# Altium schematic sheet Terminal-Sheet.SchDoc
size 420 x 297 mm; SheetNumber: 5; SheetTotal: 9
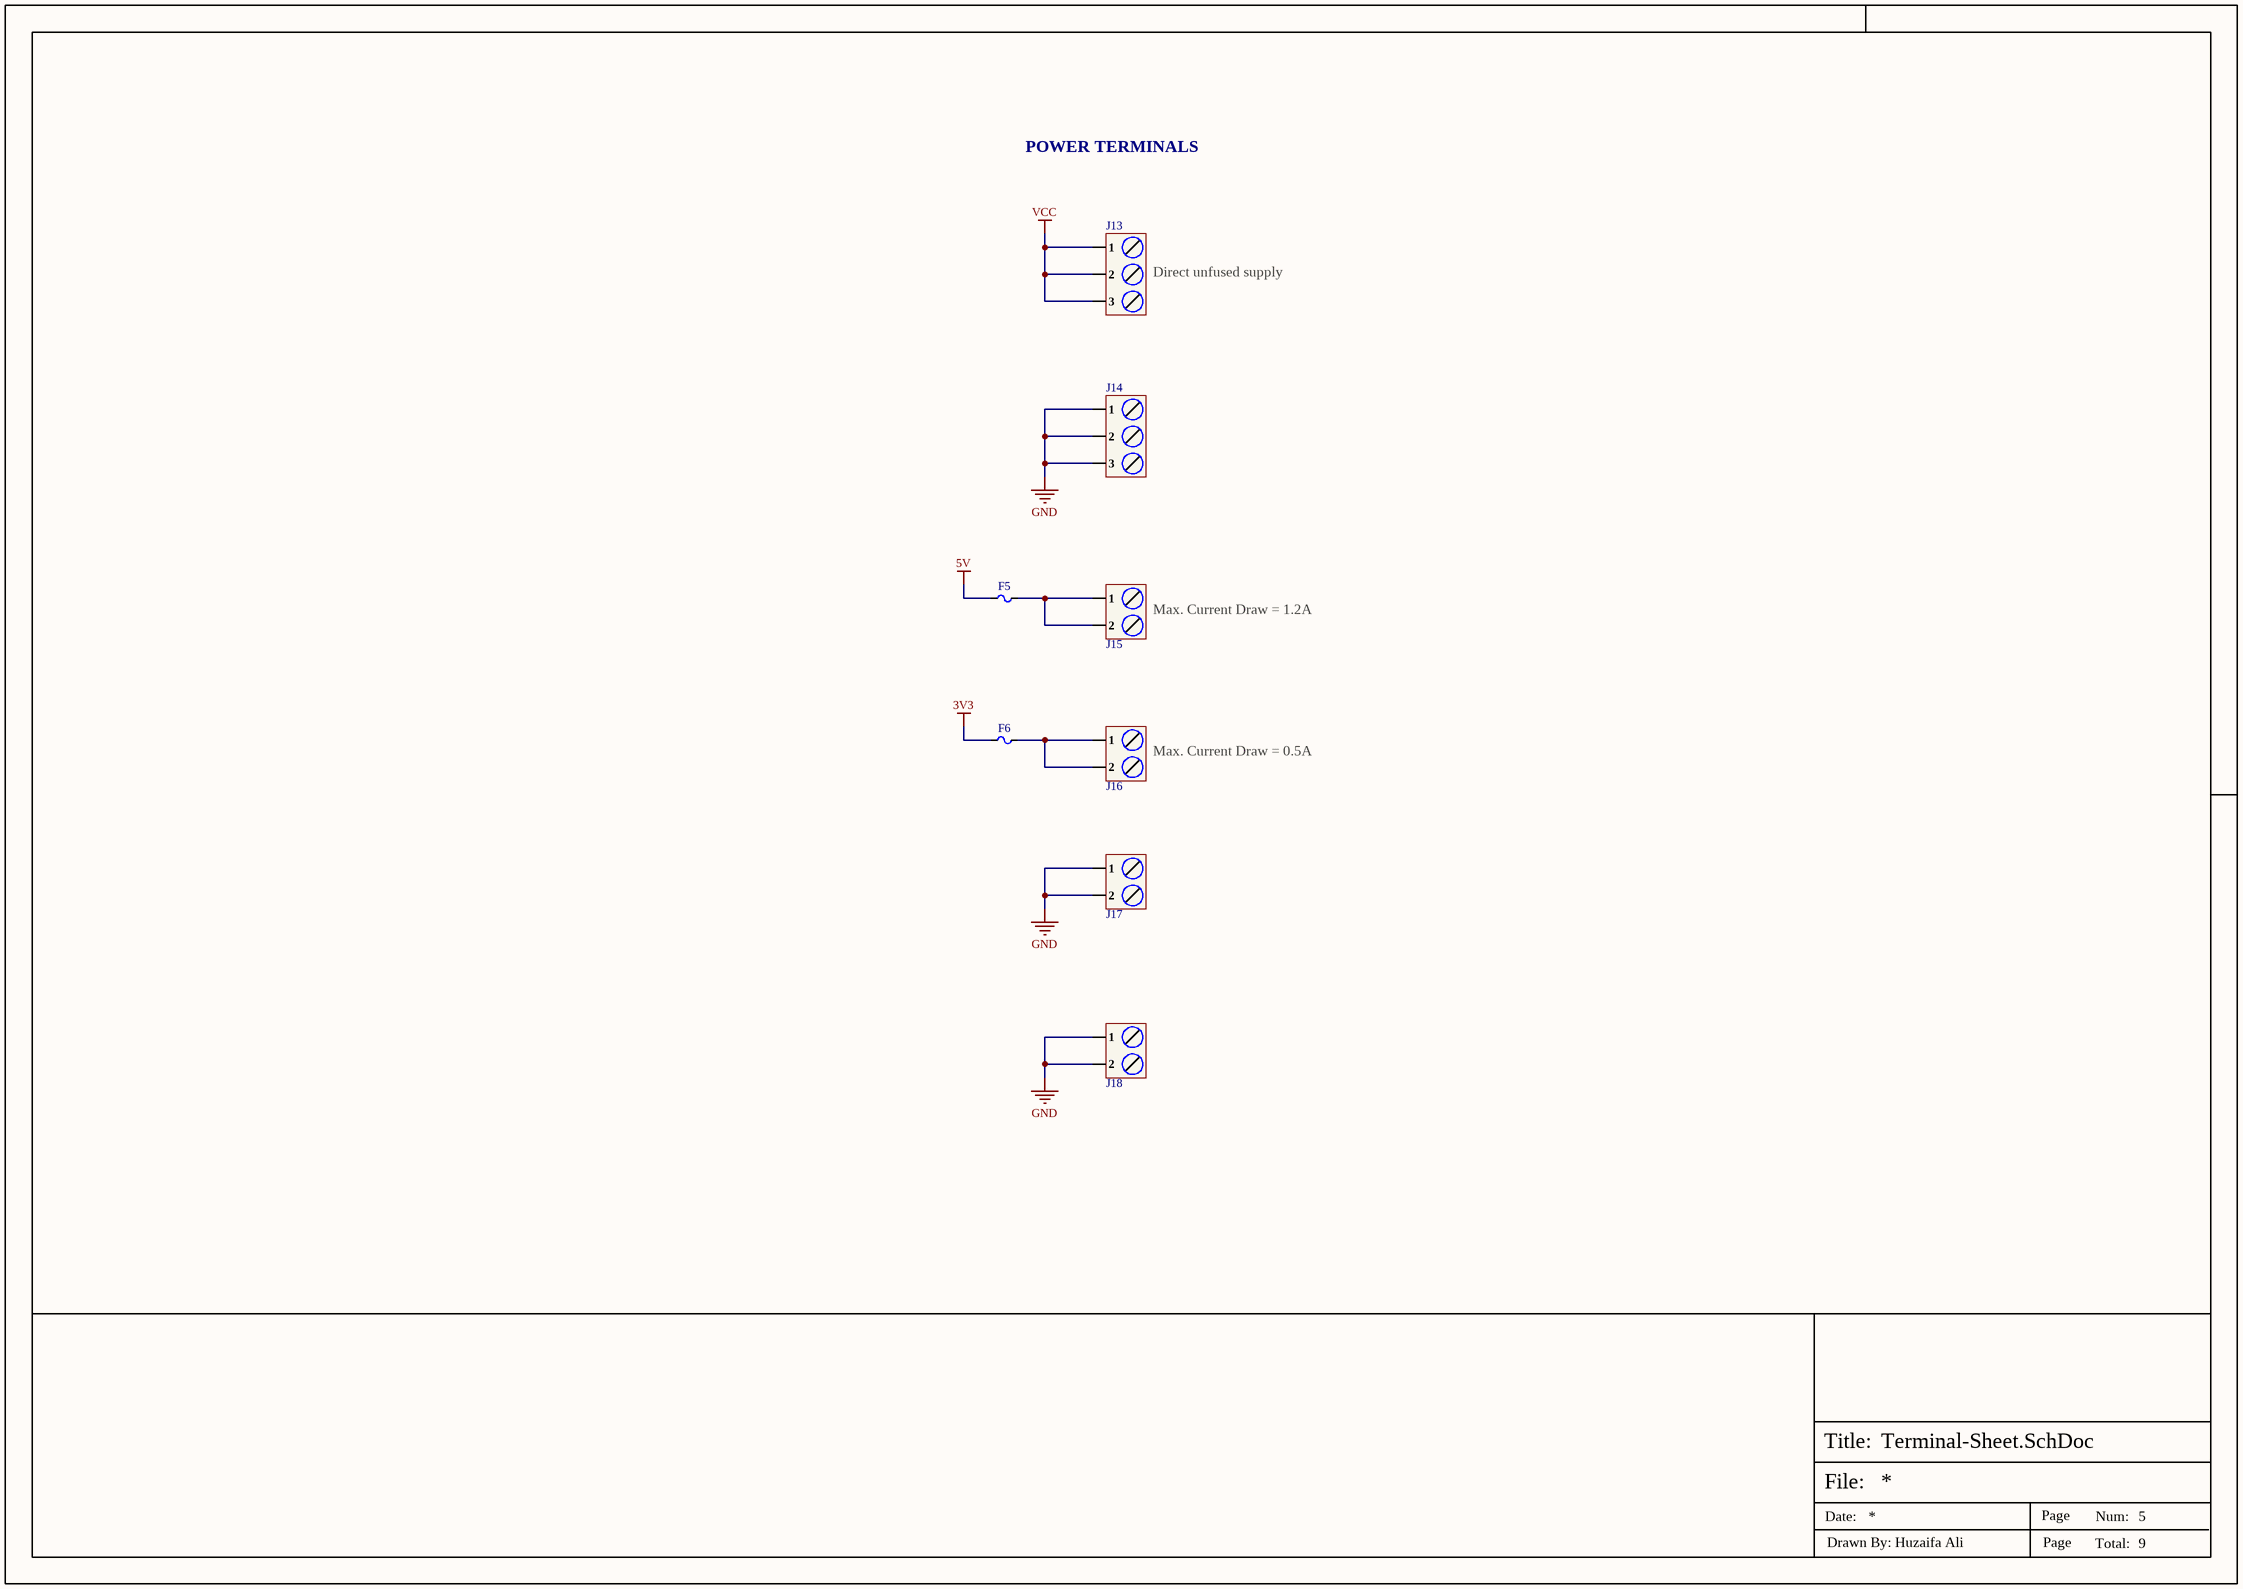
[diagram p0: Terminal-Sheet.SchDoc]

## Parts
F5  SMD0805B110TF  [Fuse-0805]  (value not drawn)
F6  0805L050WR  [Fuse-0805]  (value not drawn)
J13  DB128L-5.08-3P-GN-S  [DB128L-5.08-3P-GN-S]  (value not drawn)
J14  DB128L-5.08-3P-GN-S  [DB128L-5.08-3P-GN-S]  (value not drawn)
J15  DB128L-5.08-2P-GN-S  [DB128L-5.08-2P-GN-S]  (value not drawn)
J16  DB128L-5.08-2P-GN-S  [DB128L-5.08-2P-GN-S]  (value not drawn)
J17  DB128L-5.08-2P-GN-S  [DB128L-5.08-2P-GN-S]  (value not drawn)
J18  DB128L-5.08-2P-GN-S  [DB128L-5.08-2P-GN-S]  (value not drawn)

## Nets
3V3: F6.1
5V: F5.1
GND: J14.1 J14.2 J14.3 J17.1 J17.2 J18.1 J18.2
VCC: J13.1 J13.2 J13.3
NetF5_2: F5.2 J15.1 J15.2
NetF6_2: F6.2 J16.1 J16.2

## Notes on the sheet
- POWER TERMINALS
- (near J13) Direct unfused supply
- (near J15) Max. Current Draw = 1.2A
- (near J16) Max. Current Draw = 0.5A
- File:
- Title:
- Date:
- Page
- Num:
- Total:
- Drawn By: Huzaifa Ali

## Library data of the parts
F5 = SMD0805B110TF: PTC Resettable Fuse 6V 100A 2-Pin 0805 T/R; Manufacturer: Yageo; Item Type: PTC Resettable Fuses; Supplier: Digikey; LCSC Part Number: C269107; Manufacturer Part Number: SMD0805B110TF; RoHS: Yes; Stock: 3000; Pricing: 1=0.15, 5=0.126, 10=0.116, 50=0.0962, 100=0.0887, 250=0.07976, 500=0.07358, 1000=0.06788 (USD)
F6 = 0805L050WR: 6V 500mA 100A 1A 0805 Resettable Fuses ROHS; Manufacturer: Littelfuse; Item Type: Fuse; Supplier: DigiKey; Supplier Part Number: F2772CT-ND; Manufacturer Part Number: 0805L050WR; RoHS: Yes; Category: PTC Resettable Fuses; Stock: 52328; Pricing: 1=0.5, 5=0.41, 10=0.378, 50=0.314, 100=0.2897, 250=0.2604, 500=0.2402, 1000=0.2215 (USD); Voltage Rating: 6V; Width: 1.2mm; Height: 1.25mm; Lead Free: 5697LeadFree; ComponentLink1URL: https://datasheet.ciiva.com/326/littelfuse-ptc-0805l-326196.pdf?src-supplier=Digikey; ComponentLink1Description: https://datasheet.ciiva.com/326/littelfuse-ptc-0805l-326196.pdf?src-supplier=Digikey; ComponentLink2URL: https://datasheet.ciiva.com/4501/littelfuse-0805l-32472-4501285.pdf?src-supplier=Mouser; ComponentLink2Description: https://datasheet.ciiva.com/4501/littelfuse-0805l-32472-4501285.pdf?src-supplier=Mouser; ComponentLink3URL: https://datasheet.ciiva.com/28410/147852-28410764.pdf?src-supplier=Element14; ComponentLink3Description: https://datasheet.ciiva.com/28410/147852-28410764.pdf?src-supplier=Element14; ComponentLink4URL: https://datasheet.ciiva.com/8005/littelfuse-0805-8005343.pdf?src-supplier=Element14; ComponentLink4Description: https://datasheet.ciiva.com/8005/littelfuse-0805-8005343.pdf?src-supplier=Element14; ComponentLink5URL: https://datasheet.ciiva.com/1273/611626-1273580.pdf?src-supplier=Element14; ComponentLink5Description: https://datasheet.ciiva.com/1273/611626-1273580.pdf?src-supplier=Element14; ComponentLink6URL: https://datasheet.ciiva.com/15186/getdatasheetpartid-27833-15186860.pdf?src-supplier=Verical; ComponentLink6Description: https://datasheet.ciiva.com/15186/getdatasheetpartid-27833-15186860.pdf?src-supplier=Verical; ComponentLink7URL: https://datasheet.ciiva.com/16389/littelfuse-0805-16389019.pdf?src-supplier=Future+Electronics; ComponentLink7Description: https://datasheet.ciiva.com/16389/littelfuse-0805-16389019.pdf?src-supplier=Future+Electronics; ComponentLink8URL: https://datasheet.ciiva.com/326/littelfuse-ptc-0805l-326197.pdf?src-supplier=Digikey; ComponentLink8Description: https://datasheet.ciiva.com/326/littelfuse-ptc-0805l-326197.pdf?src-supplier=Digikey; ComponentLink9URL: https://datasheet.ciiva.com/326/littelfuse-ptc-0805l-326198.pdf?src-supplier=Digikey; ComponentLink9Description: https://datasheet.ciiva.com/326/littelfuse-ptc-0805l-326198.pdf?src-supplier=Digikey; LCSC Part Number: 0805L050WR
J13 J14 = DB128L-5.08-3P-GN-S: 1x3P 18A -40℃~+105℃ 250V Green 12~30 Direct Insert 5.08mm 2.5 1 3 Plugin,P=5.08mm Screw Terminal Blocks ROHS; Manufacturer: DORABO; Manufacturer Part Number: DB128L-5.08-3P-GN-S; Package: Plugin,P=5.08mm; LCSC Part Number: C395869; Item Type: Terminal Block; ComponentLink1Description: LCSC; ComponentLink1URL: https://www.lcsc.com/product-detail/Screw-Terminal-Blocks_DORABO-DB128L-5-08-3P-GN-S_C395869.html
J15-J18 = DB128L-5.08-2P-GN-S: 1x2P 18A -40℃~+105℃ 250V Green 12~30 Straight 5.08mm 2.5 1 2 Plugin,P=5.08mm Screw terminal ROHS; Manufacturer: DORABO; Item Type: Terminal Block; Manufacturer Part Number: DB128L-5.08-2P-GN-S; Package: Plugin,P=5.08mm; LCSC Part Number: C395868; ComponentLink1Description: LCSC; ComponentLink1URL: https://www.lcsc.com/product-detail/Screw-terminal_DORABO-DB128L-5-08-2P-GN-S_C395868.html